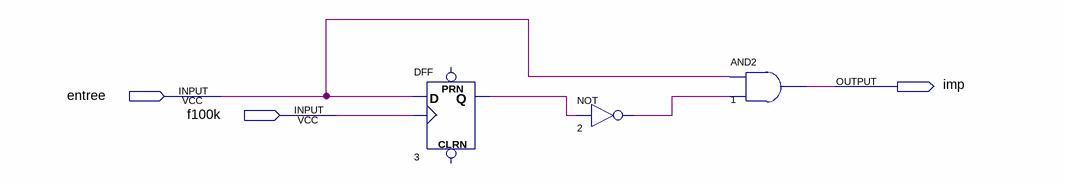
[diagram p0: schematic sheet]
// Quartus schematic detect0vers1.bdf as structural Verilog: 3 symbols, 3 pins
module detect0vers1 (
  input  entree,
  input  f100k,
  output imp
);

  wire n2_out, n3_q;

  DFF u_3 (.CLK(f100k), .D(entree), .Q(n3_q));  // open: CLRN, PRN
  not u_2 (n2_out, n3_q);
  and u_1 (imp, entree, n2_out);
endmodule
